# Altium schematic sheet Zasilanie_LMK.SchDoc
size A3
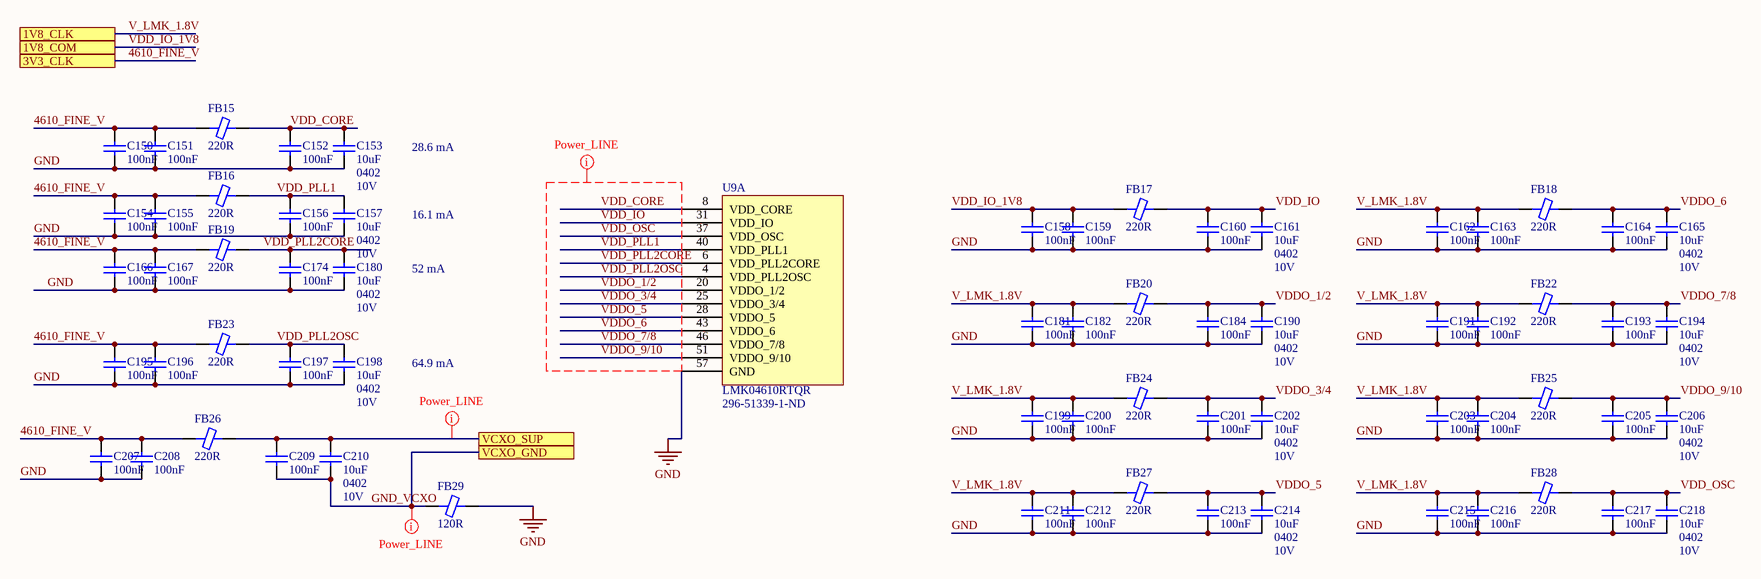
[diagram p0: Zasilanie_LMK.SchDoc]

## Parts
C150  100nF  [CAP 0201/0603 KK]
C151  100nF  [CAP 0201/0603 KK]
C152  100nF  [CAP 0201/0603 KK]
C153  10uF  Case/Package: 0402  Voltage Rating: 10V  [CAP 0402/1005 RF KK]
C154  100nF  [CAP 0201/0603 KK]
C155  100nF  [CAP 0201/0603 KK]
C156  100nF  [CAP 0201/0603 KK]
C157  10uF  Case/Package: 0402  Voltage Rating: 10V  [CAP 0402/1005 RF KK]
C158  100nF  [CAP 0201/0603 KK]
C159  100nF  [CAP 0201/0603 KK]
C160  100nF  [CAP 0201/0603 KK]
C161  10uF  Case/Package: 0402  Voltage Rating: 10V  [CAP 0402/1005 RF KK]
C162  100nF  [CAP 0201/0603 KK]
C163  100nF  [CAP 0201/0603 KK]
C164  100nF  [CAP 0201/0603 KK]
C165  10uF  Case/Package: 0402  Voltage Rating: 10V  [CAP 0402/1005 RF KK]
C166  100nF  [CAP 0201/0603 KK]
C167  100nF  [CAP 0201/0603 KK]
C174  100nF  [CAP 0201/0603 KK]
C180  10uF  Case/Package: 0402  Voltage Rating: 10V  [CAP 0402/1005 RF KK]
C181  100nF  [CAP 0201/0603 KK]
C182  100nF  [CAP 0201/0603 KK]
C184  100nF  [CAP 0201/0603 KK]
C190  10uF  Case/Package: 0402  Voltage Rating: 10V  [CAP 0402/1005 RF KK]
C191  100nF  [CAP 0201/0603 KK]
C192  100nF  [CAP 0201/0603 KK]
C193  100nF  [CAP 0201/0603 KK]
C194  10uF  Case/Package: 0402  Voltage Rating: 10V  [CAP 0402/1005 RF KK]
C195  100nF  [CAP 0201/0603 KK]
C196  100nF  [CAP 0201/0603 KK]
C197  100nF  [CAP 0201/0603 KK]
C198  10uF  Case/Package: 0402  Voltage Rating: 10V  [CAP 0402/1005 RF KK]
C199  100nF  [CAP 0201/0603 KK]
C200  100nF  [CAP 0201/0603 KK]
C201  100nF  [CAP 0201/0603 KK]
C202  10uF  Case/Package: 0402  Voltage Rating: 10V  [CAP 0402/1005 RF KK]
C203  100nF  [CAP 0201/0603 KK]
C204  100nF  [CAP 0201/0603 KK]
C205  100nF  [CAP 0201/0603 KK]
C206  10uF  Case/Package: 0402  Voltage Rating: 10V  [CAP 0402/1005 RF KK]
C207  100nF  [CAP 0201/0603 KK]
C208  100nF  [CAP 0201/0603 KK]
C209  100nF  [CAP 0201/0603 KK]
C210  10uF  Case/Package: 0402  Voltage Rating: 10V  [CAP 0402/1005 RF KK]
C211  100nF  [CAP 0201/0603 KK]
C212  100nF  [CAP 0201/0603 KK]
C213  100nF  [CAP 0201/0603 KK]
C214  10uF  Case/Package: 0402  Voltage Rating: 10V  [CAP 0402/1005 RF KK]
C215  100nF  [CAP 0201/0603 KK]
C216  100nF  [CAP 0201/0603 KK]
C217  100nF  [CAP 0201/0603 KK]
C218  10uF  Case/Package: 0402  Voltage Rating: 10V  [CAP 0402/1005 RF KK]
FB15  220R  [FER 0603/1608 KK]
FB16  220R  [FER 0603/1608 KK]
FB17  220R  [FER 0603/1608 KK]
FB18  220R  [FER 0603/1608 KK]
FB19  220R  [FER 0603/1608 KK]
FB20  220R  [FER 0603/1608 KK]
FB22  220R  [FER 0603/1608 KK]
FB23  220R  [FER 0603/1608 KK]
FB24  220R  [FER 0603/1608 KK]
FB25  220R  [FER 0603/1608 KK]
FB26  220R  [FER 0603/1608 KK]
FB27  220R  [FER 0603/1608 KK]
FB28  220R  [FER 0603/1608 KK]
FB29  120R  [FER 0603/1608 KK]
U9  LMK04610RTQR  Supplier Part Number 1: 296-51339-1-ND  [LMK04610]  (part A of 4)

## Ports
1V8_CLK, 1V8_COM, 3V3_CLK, VCXO_GND, VCXO_SUP

## Nets
GND: C150.1 C151.1 C152.1 C153.1 C154.1 C155.1 C156.1 C157.1 C158.1 C159.1 C160.1 C161.1 C162.1 C163.1 C164.1 C165.1 C166.1 C167.1 C174.1 C180.1 C181.1 C182.1 C184.1 C190.1 C191.1 C192.1 C193.1 C194.1 C195.1 C196.1 C197.1 C198.1 C199.1 C200.1 C201.1 C202.1 C203.1 C204.1 C205.1 C206.1 C207.1 C208.1 C211.1 C212.1 C213.1 C214.1 C215.1 C216.1 C217.1 C218.1 FB29.2 U9.57(GND)
4610_FINE_V: C150.2 C151.2 C154.2 C155.2 C166.2 C167.2 C195.2 C196.2 C207.2 C208.2 FB15.1 FB16.1 FB19.1 FB23.1 FB26.1 ; port 3V3_CLK
GND_VCXO: C209.1 C210.1 FB29.1 ; port VCXO_GND
V_LMK_1.8V: C162.2 C163.2 C181.2 C182.2 C191.2 C192.2 C199.2 C200.2 C203.2 C204.2 C211.2 C212.2 C215.2 C216.2 FB18.1 FB20.1 FB22.1 FB24.1 FB25.1 FB27.1 FB28.1 ; port 1V8_CLK
VCXO_SUP: C209.2 C210.2 FB26.2 ; port VCXO_SUP
VDD_CORE: C152.2 C153.2 FB15.2 U9.8(VDD_CORE)
VDD_IO: C160.2 C161.2 FB17.2 U9.31(VDD_IO)
VDD_IO_1V8: C158.2 C159.2 FB17.1 ; port 1V8_COM
VDD_OSC: C217.2 C218.2 FB28.2 U9.37(VDD_OSC)
VDD_PLL1: C156.2 C157.2 FB16.2 U9.40(VDD_PLL1)
VDD_PLL2CORE: C174.2 C180.2 FB19.2 U9.6(VDD_PLL2CORE)
VDD_PLL2OSC: C197.2 C198.2 FB23.2 U9.4(VDD_PLL2OSC)
VDDO_1/2: C184.2 C190.2 FB20.2 U9.20(VDDO_1/2)
VDDO_3/4: C201.2 C202.2 FB24.2 U9.25(VDDO_3/4)
VDDO_5: C213.2 C214.2 FB27.2 U9.28(VDDO_5)
VDDO_6: C164.2 C165.2 FB18.2 U9.43(VDDO_6)
VDDO_7/8: C193.2 C194.2 FB22.2 U9.46(VDDO_7/8)
VDDO_9/10: C205.2 C206.2 FB25.2 U9.51(VDDO_9/10)

## Layout directives
net class Power_LINE: GND_VCXO, VCXO_SUP, VDD_CORE, VDD_IO, VDD_OSC, VDD_PLL1, VDD_PLL2CORE, VDD_PLL2OSC, VDDO_1/2, VDDO_3/4, VDDO_5, VDDO_6, VDDO_7/8, VDDO_9/10

## Notes on the sheet
- 28.6 mA
- 16.1 mA
- 52 mA
- 64.9 mA
- Title
- Size:
- Date:
- A3
- Number:
- Time:
- Revision:
- Sheet
- of
- File:

## Library data of the parts
C150-C152 C154-C156 C158-C160 C162-C164 C166 C167 C174 C181 C182 C184 C191-C193 C195-C197 C199-C201 C203-C205 C207-C209 C211-C213 C215-C217 = Capacitor: Manufacturer 1: Murata; Manufacturer Part Number 1: GRM033R61C104ME84D; Voltage Rating: 16V; Tolerance: 20%; Dielectric: X5R; Supplier 1: Digi-Key; Supplier Part Number 1: 490-9986-1-ND; Stock 1: 503570; Pricing 1: 1=0.10000, 10=0.05400, 100=0.02430, 500=0.01732, 1000=0.01361, 2500=0.01238, 5000=0.01139 (USD); RoHS: Yes; Mount: Surface Mount; Case/Package: 0201; Weight: 1.2E-05oz; Case Code (Metric): 0603; Case Code (Imperial): 0201; Min Operating Temperature: -55°C; Max Operating Temperature: 85°C; Capacitance: 100nF; Packaging: Tape and Reel; Termination: SMD/SMT; Voltage Rating (DC): 16V; Package Quantity: 15000; Length: 0.024inch; Height: 0.3mm; Width: 0.3mm; Thickness: 0.013inch; ComponentLink1URL: http://www.mouser.com/ds/2/281/c02e-2905.pdf?src-supplier=Mouser; ComponentLink1Description: http://www.mouser.com/ds/2/281/c02e-2905.pdf?src-supplier=Mouser; ComponentLink2URL: http://search.murata.co.jp/Ceramy/image/img/A01X/G101/ENG/GRM033R61C104ME84-01.pdf?src-supplier=Digi-Key; ComponentLink2Description: http://search.murata.co.jp/Ceramy/image/img/A01X/G101/ENG/GRM033R61C104ME84-01.pdf?src-supplier=Digi-Key
C153 C157 C161 C165 C180 C190 C194 C198 C202 C206 C210 C214 C218 = Capacitor: CAP CER 10UF 10V X5R 0402; Manufacturer: Samsung; Manufacturer Part Number: CL05A106MP8NUB8; Tolerance: 20%; Supplier 1: Digi-Key; Supplier Part Number 1: 1276-6830-1-ND; RoHS: Yes; Category: Ceramic Capacitors; Stock 1: 1457006; Pricing 1: 1=0,40000, 10=0,27900, 50=0,19500, 100=0,16710, 500=0,12534, 1000=0,10584, 2500=0,10027 (USD); Mount: Surface Mount; Case Code (Metric): 1005; Case Code (Imperial): 0402; Min Operating Temperature: -55°C; Max Operating Temperature: 85°C; Packaging: Tape and Reel; Capacitance: 10uF; Length: 0.039inch; Width: 0.02inch; Thickness: 0.035inch; ComponentLink1URL: http://www.samsungsem.com/kr/support/product-search/mlcc/CL05A106MP8NUB8.jsp?src-supplier=Digi-Key; ComponentLink1Description: http://www.samsungsem.com/kr/support/product-search/mlcc/CL05A106MP8NUB8.jsp?src-supplier=Digi-Key
FB15-FB20 FB22-FB28 = Ferrite: Manufacturer 1: Samsung; Manufacturer Part Number 1: CIS10P221NC; Current Rating: 2.5A; Tolerance: 25%; Number of Lines: 1; DC Resistance (DCR): 50mR; Supplier 1: Digi-Key; Supplier Part Number 1: 1276-6350-2-ND; Stock 1: 336000; Pricing 1: 4000=0.00880, 8000=0.00660, 12000=0.00638, 28000=0.00616, 100000=0.00572 (USD); RoHS: Yes; Mount: Surface Mount; Case/Package: 0603; Core Material: Ferrite; Case Code (Metric): 1608; Case Code (Imperial): 0603; Min Operating Temperature: -55°C; Max Operating Temperature: 125°C; Package Quantity: 1; Packaging: Cut Tape; Impedance: 220R; Max Current Rating: 2.5A; Max DC Current: 2.5A; Length: 0.063inch; Height: 0.037inch; Width: 0.031inch; Depth: 0.8mm; Radiation Hardening: No; Lead Free: Lead Free; ComponentLink1URL: https://datasheet.ciiva.com/29994/cis10p101ac-29994155.pdf?src-supplier=Avnet; ComponentLink1Description: https://datasheet.ciiva.com/29994/cis10p101ac-29994155.pdf?src-supplier=Avnet; ComponentLink2URL: https://datasheet.ciiva.com/16395/cic21-series-16395893.pdf?src-supplier=Future+Electronics; ComponentLink2Description: https://datasheet.ciiva.com/16395/cic21-series-16395893.pdf?src-supplier=Future+Electronics
FB29 = Ferrite: Manufacturer 1: TDK; Manufacturer Part Number 1: MPZ1608S121ATAH0; Current Rating: 2A; Tolerance: 25%; DC Resistance (DCR): 45mR; Supplier 1: Digi-Key; Supplier Part Number 1: 445-5219-1-ND; Stock 1: 68096; Pricing 1: 1=0.10000, 10=0.07900, 25=0.07160, 50=0.06440, 100=0.04720, 250=0.03432, 500=0.03146, 1000=0.02717 (USD); RoHS: Yes; Mount: Surface Mount; Case/Package: 0603; Core Material: Ferrite; Case Code (Metric): 1608; Case Code (Imperial): 0603; Package Quantity: 4000; Packaging: Tape and Reel; Impedance: 120R; Max DC Current: 2A; Length: 0.063inch; Height: 0.03inch; Width: 0.031inch; Depth: 0.8mm; ComponentLink1URL: https://datasheet.ciiva.com/46634/beads-commercial-power-mpz-en-46634726.pdf?src-supplier=Digi-Key; ComponentLink1Description: https://datasheet.ciiva.com/46634/beads-commercial-power-mpz-en-46634726.pdf?src-supplier=Digi-Key; ComponentLink2URL: https://datasheet.ciiva.com/46634/beads-commercial-power-mpz-en-46634728.pdf?src-supplier=Digi-Key; ComponentLink2Description: https://datasheet.ciiva.com/46634/beads-commercial-power-mpz-en-46634728.pdf?src-supplier=Digi-Key; ComponentLink3URL: https://datasheet.ciiva.com/48682/beads-commercial-power-mpz-en-48682494.pdf?src-supplier=Avnet; ComponentLink3Description: https://datasheet.ciiva.com/48682/beads-commercial-power-mpz-en-48682494.pdf?src-supplier=Avnet
U9 = LMK04610RTQR: Manufacturer: Texas Instruments; Number of Inputs: 2; Number of Outputs: 10; Supplier 1: Digi-Key; Manufacturer Part Number: LMK04610RTQR; Stock 1: 2022; Pricing 1: 1 = 20,47000, 10 = 18,87700, 100 = 16,11940, 500 = 14,63474 (USD); RoHS: No; Min Operating Temperature: -40°C; Max Operating Temperature: 85°C